# Altium project Senzorska_plocica.PrjPcb
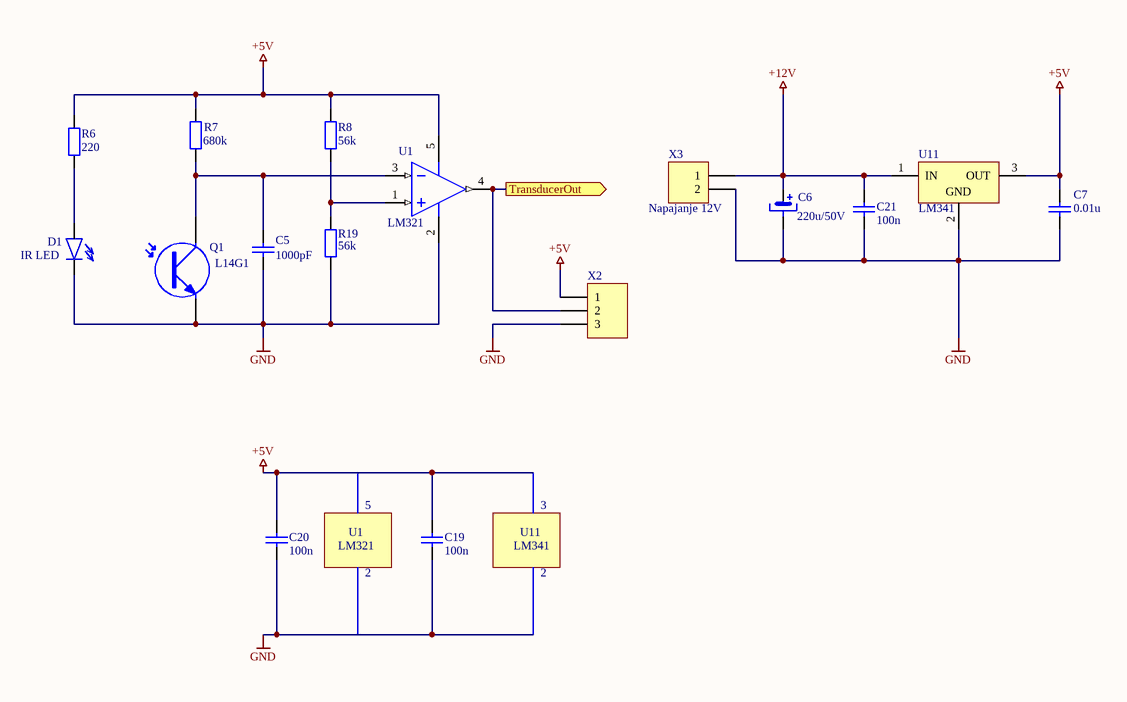
[diagram p0: Senzor.SchDoc]
1 sheet, 16 parts. Net scope: flat (ports and power ports of the same name join across sheets).
Board file: Senzor.PcbDoc

## Sheet Senzor.SchDoc
size A4; SheetNumber: 1; SheetTotal: 1

### Parts
C5  1000pF  [RAD-0.1]
C6  220u/50V  [CAPR5-4x5]
C7  0.01u  [RAD-0.1]
C19  100n  [RAD-0.1]
C20  100n  [RAD-0.1]
C21  100n  [RAD-0.1]
D1  IR LED  [vish-tsal6200]
Q1  L14G1  [TO-220_A]
R6  220  [AXIAL-0.4]
R7  680k  [AXIAL-0.4]
R8  56k  [AXIAL-0.4]
R19  56k  [AXIAL-0.4]
U1  LM321  [DBV0005A_L]
U11  LM341  [NDE0003A]
X2  (no value)  [HDR1X3]
X3  Napajanje 12V  [HDR1X2]

### Ports
TransducerOut (out)

### Nets
+5V: C7.2 C19.2 C20.2 R6.1 R7.2 R8.2 U1.5(V+) U11.3(OUT) X2.1
+12V: C6.1 C21.2 U11.1(IN) X3.1
GND: C5.1 C6.2 C7.1 C19.1 C20.1 C21.1 D1.1 Q1.3(E) R19.1 U1.2(V-) U11.2(GND) X2.3 X3.2
NetC5_2: C5.2 Q1.1(C) R7.1 U1.3(IN-)
NetD1_2: D1.2 R6.2
NetR8_1: R8.1 R19.2 U1.1(IN+)
NetU1_4: U1.4(OUT) X2.2 ; port TransducerOut

### Notes on the sheet
- U1
- 5
- U11
- 3
- LM321
- 2
- LM341

### Library data of the parts
C5 = Cap: Capacitor; Dobavljac: DigiKey; Cijena: €0,47; Kataloški broj: BC5131-ND; Proizvođač: Vishay Beyschlag/Draloric/BC Components; Opis: Keramički kondenzator 1000pF; Kućište: 2.3x3.4mm; 2 izvoda; pitch 5.0mm; žičani izvodi; PackageReference: RAD-0.3; Vrijednost: 1000pF
C6 = Elko: Dobavljac: DigiKey; Cijena: €0,69; Kataloški broj: P5572-ND; Proizvođač: Panasonic Electronic Components; Opis: Elektrolitski kondenzator 220u/50V; Kućište: 6.3x11.2mm; 2 izvoda; pitch 2.5mm; žičani izvodi; Vrijednost: 220u/50V
C7 = Cap: Capacitor; Vrijednost: 0.01uF; Dobavljac: DigiKey; Cijena: €0,21; Kataloški broj: BC5134-ND; Proizvođač: Vishay Beyschlag/Draloric/BC Components; Opis: Keramički kondenzator 0.01uF; Kućište: 2.3x4.0mm; 2 izvoda; pitch 5.0mm; žičani izvodi; PackageReference: RAD-0.3
C19-C21 = Cap: Capacitor; Vrijednost: 100nF; Dobavljac: DigiKey; Cijena: €0,23; Kataloški broj: BC3324-ND; Proizvođač: Vishay Beyschlag/Draloric/BC Components; Opis: Keramički kondenzator 100nF; Kućište: 2.3x6.0mm; 2 izvoda; pitch 7.5mm; žičani izvodi; PackageReference: RAD-0.3
D1 = INFRARED LED: 940 Nm, Gaalas/gaas, High Power Infrared Emitting Diode Infrared Led, 5MM, 1-ELEMENT, 940NM; Dobavljac: DigiKey; Cijena: €0,42; Kataloški broj: TSAL6200; Proizvođač: Vishay Semiconductor Opto Division; Opis: Infracrvena LED dioda; Kućište: 5mm dijametar; 2 izvoda; pitch 2.54mm; žičani izvodi
Q1 = Photo NPN: NPN Phototransistor; Dobavljac: DigiKey; Cijena: €3,13; Kataloški broj: 751-1020-ND; Proizvođač: Vishay Semiconductor Opto Division; Opis: NPN fototranzistor; Kućište: 1206; PackageReference: TO-220_A
R6 = Res2: Resistor; Dobavljac: DigiKey; Cijena: €0,09; Kataloški broj: MFR-25FBF52-220R-ND; Proizvođač: YAGEO; Opis: Otpornik 220 Ohm; Kućište: 2.4x6.3mm; 2 izvoda; pitch 10mm; žičani izvodi; PackageReference: AXIAL-0.4; Vrijednost: 220
R7 = Res2: Resistor; Dobavljac: DigiKey; Cijena: €0,09; Kataloški broj: MFR-25FBF52-680K-ND; Proizvođač: YAGEO; Opis: Otpornik 680kOhm; Kućište: 2.4x6.3mm; 2 izvoda; pitch 10mm; žičani izvodi; PackageReference: AXIAL-0.4; Vrijednost: 680K
R8 R19 = Res2: Resistor; Dobavljac: DigiKey; Cijena: €0,09; Kataloški broj: MFR-25FBF52-56K-ND; Proizvođač: YAGEO; Opis: Otpornik 56kOhm; Kućište: 2.4x6.3mm; 2 izvoda; pitch 10mm; žičani izvodi; PackageReference: AXIAL-0.4; Vrijednost: 56K
U1 = CMP-0055-01337-3: Low Power Single Op Amp, 5-pin SOT-23; Dobavljac: DigiKey; Cijena: €0,90; Kataloški broj: LM321MF/NOPBCT-ND; Proizvođač: Texas Instruments; Opis: Operacijsko pojačalo; Kućište: SOT-23-5
U11 = CMP-0062-02431-3: 3-Terminal Positive Voltage Regulators, 3-pin TO-220; Dobavljac: DigiKey; Cijena: €1,24; Kataloški broj: LM341T-5.0/NOPB-ND; Proizvođač: Texas Instruments; Opis: Pozitivni naponski regulator 5V; PackageReference: NDE0003A; Kućište: TO-220
X2 = Header 3: Header, 3-Pin; Dobavljac: DigiKey; Cijena: €0,28; Kataloški broj: S1011EC-03-ND; Proizvođač: Sullins Connector Solutions; Opis: 3-pinski konektor; Kućište: 7.62x2.54mm; 3 izvoda; pitch 2.54mm; žičani izvodi
X3 = Header 2: Header, 2-Pin; Dobavljac: DigiKey; Cijena: €0,26; Kataloški broj: S1011EC-02-ND; Proizvođač: Sullins Connector Solutions; Opis: 2-pinski konektor; Kućište: 5.08x2.54mm; 2 izvoda; pitch 2.54mm; žičani izvodi